# Altium project Board1.PrjPcb
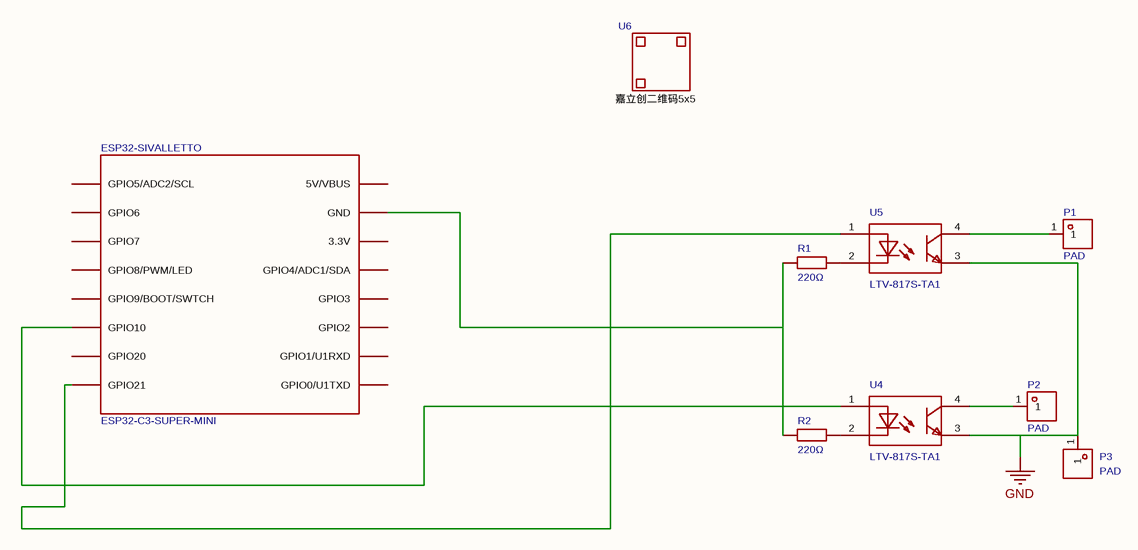
[diagram p0: P1.schdoc]
1 sheet, 9 parts. Net scope: global (net labels, ports and power ports of the same name join across sheets).
Board file: PCB1.pcbdoc

## Sheet P1.schdoc
size 297 x 209 mm; Symbol: Drawing-Symbol_A4; @Project Name: controller-cancello; @Page Count: 1; @Update Date: 2025-05-18; @Create Date: 2025-05-18; @Schematic Name: Schematic1; @Page No: 1; @Page Name: P1; Company: EasyEDA.com; Version: V1.0; Page Size: A4; @Create Time: 19:32:24; @Update Time: 11:41:42; Border: 1; Width: 1170; Height: 825; Region Start: 1; X Region Count: 6; Y Region Count: 4; Blade Width: 10; Title Block Position: 3; @Board Name: Board1; Device: Drawing-Symbol_A4

### Parts
ESP32-SIVALLETTO  ESP32-C3-SUPER-MINI  [ESP32-C3-SUPER-MINI]
P1  PAD  [PAD-SMD_L5.0-W2.0_STHW4-DU-HN050206]
P2  PAD  [PAD-SMD_L5.0-W2.0_STHW4-DU-HN050206]
P3  PAD  [PAD-SMD_L5.0-W2.0_STHW4-DU-HN050206]
R1  220Ω  [RES-TH_BD2.2-L6.5-P10.50-D0.6]
R2  220Ω  [RES-TH_BD2.2-L6.5-P10.50-D0.6]
U4  LTV-817S-TA1  [OPTO-SMD-4_L4.6-W6.5-P2.54-LS10.3-BL]
U5  LTV-817S-TA1  [OPTO-SMD-4_L4.6-W6.5-P2.54-LS10.3-BL]
U6  (no value)  [JLC-QRCODE-5x5]

### Nets
GND: P3.1 U4.3 U5.3
NetESP32-SIVALLETTO_6: ESP32-SIVALLETTO.6(GPIO10) U4.1
NetESP32-SIVALLETTO_8: ESP32-SIVALLETTO.8(GPIO21) U5.1
NetESP32-SIVALLETTO_15: ESP32-SIVALLETTO.15(GND) R1.1 R2.1
NetP1_1: P1.1 U5.4
NetP2_1: P2.1 U4.4
NetR1_2: R1.2 U5.2
NetR2_2: R2.2 U4.2

Not connected (* = marked no-connect by the designer): ESP32-SIVALLETTO 1(GPIO5/ADC2/SCL) 2(GPIO6) 3(GPIO7) 4(GPIO8/PWM/LED) 5(GPIO9/BOOT/SWTCH) 7(GPIO20) 9(GPIO0/U1TXD) 10(GPIO1/U1RXD) 11(GPIO2) 12(GPIO3) 13(GPIO4/ADC1/SDA) 14(3.3V) 16(5V/VBUS)

### Notes on the sheet
- Create at
- 2025-05-18
- Schematic
- Board
- Schematic1
- Board1
- Update at
- Page
- P1
- Drawn
- Reviewed
- controller-cancello
- Version
- V1.0
- Size
- A4
- Page  1  Total  1
- EasyEDA.com

### Library data of the parts
ESP32-SIVALLETTO = ESP32-C3-SUPER-MINI: Manufacturer: Maker go; AddInBom: yes; Device: ESP32-C3-SUPER-MINI; link: https://www.tindie.com/products/adz1122/esp32-c3-development-board-esp32-supermini/; ConvertToPcb: yes; SymbolName: ESP32-C3-SUPER-MINI; FootprintName: ESP32-C3-SUPER-MINI
P1-P3 = PAD: AddInBom: yes; Symbol: PAD; Device: PAD; LCSC Part Name: PAD; SupplierPart: C9900017271; ManufacturerPart: PAD; Supplier Footprint: PAD; JLCPCB Part Class: Extended Part; Supplier: LCSC; ConvertToPcb: yes; FootprintName: PAD-SMD_L5.0-W2.0_STHW4-DU-HN050206
R1 R2 = MF1/4W-220Ω±1% T: Type:Metal Film Resistors Resistance: Tolerance:±1% Tolerance:±1% Voltage-Supply(Max):250V Power(Watts):250mW Temperature Coefficient:±100ppm/℃ Temperature Coefficient:±100ppm/℃ Operating Temperature:-55℃~+155℃ Operating Temperature:-55℃~+155℃; Manufacturer: CCO(千志电子); AddInBom: yes; ModelId: 259c3103781c424fb695c8049f0a17f3; ModelTransform: 437.007,91.18383,0,0,0,0,0,0,-137.795; Tolerance: ±1%; Voltage-Supply(Max): 250V; Power(Watts): 250mW; Symbol: MF1/4W-220Ω±1%; Device: MF1/4W-220Ω±1% T; LCSC Part Name: 220Ω ±1% 250mW 金属膜电阻 圆柱状直插; SupplierPart: C127220; ManufacturerPart: MF1/4W-220Ω±1% T; Supplier Footprint: 插件,D2.3xL6.5mm; JLCPCB Part Class: Extended Part; Datasheet: https://atta.szlcsc.com/upload/public/pdf/source/20190910/C427326_62A6D058BC0FF74963A2F22379CA06CE.pdf; Supplier: LCSC; ConvertToPcb: yes; FootprintName: RES-TH_BD2.2-L6.5-P10.50-D0.6; ModelName: RES-TH_BD2.2-L6.5-P10.50-D0.6; Type: Metal Film Resistors; Value: 220Ω; Temperature Coefficient: ±100ppm/℃; Operating Temperature: -55℃~+155℃
U4 U5 = LTV-817S-TA1: Input voltage type:DC Output Type:光电三极管 Forward Voltage:1.2V Output Current:50mA Isolation Voltage(rms):5kV Reverse Voltage:6V Receiving End Voltage:35V Number of Outputs:1 Collector-Emitter Saturation Voltage (Vce(sat)@Ic,IF):100mV@1mA,20mA Rise time:4us; Manufacturer: LITEON(光宝); AddInBom: yes; ModelId: 9d4cded8570a44bda9996ea26f6726e5; ModelName: OPTO-SMD-4_L4.6-W6.5-H3.6-LS10.2-P2.54; ModelTransform: 401.574,181.102,0,90,0,0,0,0,0; Input voltage type: DC; Output Type: 光电三极管; Forward Voltage: 1.2V; Output Current: 50mA; Isolation Voltage(rms): 5kV; Reverse Voltage: 6V; Receiving End Voltage: 35V; Number of Outputs: 1; Rise time: 4us@2mA,100Ω; Fall time: 3us@2mA,100Ω; Device: LTV-817S-TA1; Symbol: LTV-817S-TA1; LCSC Part Name: DC输入 隔离电压(rms):5000V; SupplierPart: C125121; ManufacturerPart: LTV-817S-TA1; Supplier Footprint: SMD-4P; JLCPCB Part Class: Extended Part; Datasheet: https://atta.szlcsc.com/upload/public/pdf/source/20180327/C189217_D5934DAD831E4B359A8CC3E92A85B427.pdf; Supplier: LCSC; ConvertToPcb: yes; FootprintName: OPTO-SMD-4_L4.6-W6.5-P2.54-LS10.3-BL; Collector-Emitter Saturation Voltage (Vce(sat)@Ic,IF): 100mV@1mA,20mA; Operating Temperature: -55℃~+110℃
U6 = JLC-QRCODE-5x5: AddInBom: yes; SymbolName: 嘉立创二维码5x5; ModelTransform: 0, 0, 0, 0, 0, 0, 0, 0, 0; Device: JLC-QRCODE-5x5; ConvertToPcb: yes; FootprintName: JLC-QRCODE-5x5